# Altium schematic sheet GTR.SchDoc: GTR
size A3; Organization: Altium Limited; Address1: L3, 12a Rodborough Rd; Address2: Frenchs Forest; Address3: NSW; Address4: Australia 2086
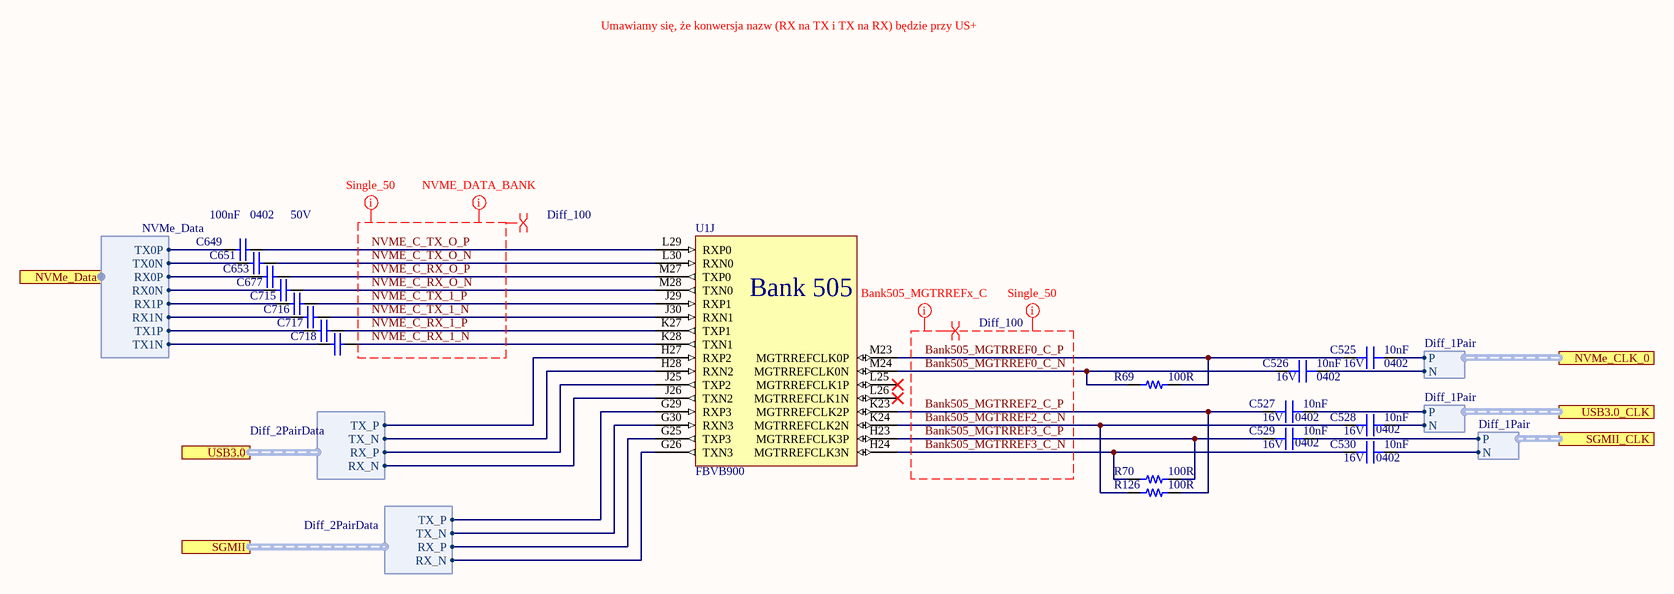
[diagram p0: GTR.SchDoc]

## Parts
C525  10nF  Case/Package: 0402  Voltage Rating (DC): 16V  [CAP 0402/1005 KK]
C526  10nF  Case/Package: 0402  Voltage Rating (DC): 16V  [CAP 0402/1005 KK]
C527  10nF  Case/Package: 0402  Voltage Rating (DC): 16V  [CAP 0402/1005 KK]
C528  10nF  Case/Package: 0402  Voltage Rating (DC): 16V  [CAP 0402/1005 KK]
C529  10nF  Case/Package: 0402  Voltage Rating (DC): 16V  [CAP 0402/1005 KK]
C530  10nF  Case/Package: 0402  Voltage Rating (DC): 16V  [CAP 0402/1005 KK]
C649  100nF  Case Code (Imperial): 0402  Voltage: 50V  [CAP 0402/1005 KK]
C651  100nF  [CAP 0402/1005 KK]  (value not drawn)
C653  100nF  [CAP 0402/1005 KK]  (value not drawn)
C677  100nF  [CAP 0402/1005 KK]  (value not drawn)
C715  100nF  [CAP 0402/1005 KK]  (value not drawn)
C716  100nF  [CAP 0402/1005 KK]  (value not drawn)
C717  100nF  [CAP 0402/1005 KK]  (value not drawn)
C718  100nF  [CAP 0402/1005 KK]  (value not drawn)
R69  100R  [RES 0402/1005 RF KK]
R70  100R  [RES 0402/1005 RF KK]
R126  100R  [RES 0402/1005 RF KK]
U1  FBVB900  [FBVB900 XX]  (part J of 23)

## Ports
NVMe_CLK_0 (harness Diff_1Pair), NVMe_Data (harness NVMe_Data), SGMII (harness Diff_2PairData), SGMII_CLK (harness Diff_1Pair), USB3.0 (harness Diff_2PairData), USB3.0_CLK (harness Diff_1Pair)

## Harnesses
NVMe_Data: RX0P, RX0N, TX0P, TX0N, RX1P, RX1N, TX1P, TX1N
Diff_1Pair: P, N
Diff_2PairData: RX_P, RX_N, TX_P, TX_N

## Nets
Bank505_MGTRREF0_C_N: C526.1 R69.2 U1.M24(MGTRREFCLK0N)
Bank505_MGTRREF0_C_P: C525.1 R69.1 U1.M23(MGTRREFCLK0P)
Bank505_MGTRREF2_C_N: C528.1 R126.2 U1.K24(MGTRREFCLK2N)
Bank505_MGTRREF2_C_P: C527.1 R126.1 U1.K23(MGTRREFCLK2P)
Bank505_MGTRREF3_C_N: C530.1 R70.2 U1.H24(MGTRREFCLK3N)
Bank505_MGTRREF3_C_P: C529.1 R70.1 U1.H23(MGTRREFCLK3P)
NVME_C_RX_1_N: C718.1 U1.K28(TXN1)
NVME_C_RX_1_P: C717.1 U1.K27(TXP1)
NVME_C_RX_O_N: C677.1 U1.M28(TXN0)
NVME_C_RX_O_P: C653.1 U1.M27(TXP0)
NVME_C_TX_1_N: C716.1 U1.J30(RXN1)
NVME_C_TX_1_P: C715.1 U1.J29(RXP1)
NVME_C_TX_O_N: C651.1 U1.L30(RXN0)
NVME_C_TX_O_P: C649.1 U1.L29(RXP0)
NetC525_2: C525.2 ; port NVMe_CLK_0.P
NetC526_2: C526.2 ; port NVMe_CLK_0.N
NetC527_2: C527.2 ; port USB3.0_CLK.P
NetC528_2: C528.2 ; port USB3.0_CLK.N
NetC529_2: C529.2 ; port SGMII_CLK.P
NetC530_2: C530.2 ; port SGMII_CLK.N
NetC649_2: C649.2 ; port NVMe_Data.TX0P
NetC651_2: C651.2 ; port NVMe_Data.TX0N
NetC653_2: C653.2 ; port NVMe_Data.RX0P
NetC677_2: C677.2 ; port NVMe_Data.RX0N
NetC715_2: C715.2 ; port NVMe_Data.RX1P
NetC716_2: C716.2 ; port NVMe_Data.RX1N
NetC717_2: C717.2 ; port NVMe_Data.TX1P
NetC718_2: C718.2 ; port NVMe_Data.TX1N
NetU1_G25: U1.G25(TXP3) ; port SGMII.RX_P
NetU1_G26: U1.G26(TXN3) ; port SGMII.RX_N
NetU1_G29: U1.G29(RXP3) ; port SGMII.TX_P
NetU1_G30: U1.G30(RXN3) ; port SGMII.TX_N
NetU1_H27: U1.H27(RXP2) ; port USB3.0.TX_P
NetU1_H28: U1.H28(RXN2) ; port USB3.0.TX_N
NetU1_J25: U1.J25(TXP2) ; port USB3.0.RX_P
NetU1_J26: U1.J26(TXN2) ; port USB3.0.RX_N

Not connected (* = marked no-connect by the designer): U1 L25(MGTRREFCLK1P)* L26(MGTRREFCLK1N)*

## Layout directives
net class Bank505_MGTRREFx_C: Bank505_MGTRREF0_C_N, Bank505_MGTRREF0_C_P, Bank505_MGTRREF2_C_N, Bank505_MGTRREF2_C_P, Bank505_MGTRREF3_C_N, Bank505_MGTRREF3_C_P
net class NVME_DATA_BANK: NVME_C_RX_1_N, NVME_C_RX_1_P, NVME_C_RX_O_N, NVME_C_RX_O_P, NVME_C_TX_1_N, NVME_C_TX_1_P, NVME_C_TX_O_N, NVME_C_TX_O_P
net class Single_50: Bank505_MGTRREF0_C_N, Bank505_MGTRREF0_C_P, Bank505_MGTRREF2_C_N, Bank505_MGTRREF2_C_P, Bank505_MGTRREF3_C_N, Bank505_MGTRREF3_C_P, NVME_C_RX_1_N, NVME_C_RX_1_P, NVME_C_RX_O_N, NVME_C_RX_O_P, NVME_C_TX_1_N, NVME_C_TX_1_P, NVME_C_TX_O_N, NVME_C_TX_O_P
differential pair; differential pair class Diff_100: Bank505_MGTRREF0_C_N, Bank505_MGTRREF0_C_P, Bank505_MGTRREF2_C_N, Bank505_MGTRREF2_C_P, Bank505_MGTRREF3_C_N, Bank505_MGTRREF3_C_P, NVME_C_RX_1_N, NVME_C_RX_1_P, NVME_C_RX_O_N, NVME_C_RX_O_P, NVME_C_TX_1_N, NVME_C_TX_1_P, NVME_C_TX_O_N, NVME_C_TX_O_P

## Notes on the sheet
- Umawiamy się, że konwersja nazw (RX na TX i TX na RX) będzie przy US+
- Title
- Size:
- Date:
- A3
- Number:
- Time:
- Revision:
- Sheet
- of
- File:
- (in symbol FBVB900, part J) Bank 505

## Library data of the parts
C525-C530 = Capacitor: Manufacturer: KEMET; Manufacturer Part Number: C0402C103K4RACTU; Dielectric Material: Ceramic; Tolerance: 10%; Dielectric: X7R; Dissipation Factor: 3.5%; Supplier 1: Digi-Key; Supplier Part Number 1: 399-1038-1-ND; Stock 1: 1112674; Pricing 1: 1 = 0,10000, 10 = 0,02800, 100 = 0,01240, 500 = 0,00886, 1000 = 0,00696, 2500 = 0,00632, 5000 = 0,00582 (USD); RoHS: Yes; Mount: Surface Mount,PCB; Number of Pins: 2; Case Code (Metric): 1005; Case Code (Imperial): 0402; Contact Plating: Tin,Matte; Min Operating Temperature: -55°C; Max Operating Temperature: 125°C; Capacitance: 10nF; Packaging: Tape and Reel; Package Quantity: 1; Voltage Rating: 16V; Termination: SMD/SMT; Voltage: 16V; Length: 1mm; Height: 0.5mm; Width: 0.02inch; Depth: 0.5mm; Thickness: 0.022inch; Lead Pitch: 0.3mm; Radiation Hardening: No; REACH SVHC: No SVHC; ComponentLink1URL: https://datasheet.ciiva.com/14595/70095383-14595321.pdf?src-supplier=Allied+Electronics; ComponentLink1Description: https://datasheet.ciiva.com/14595/70095383-14595321.pdf?src-supplier=Allied+Electronics; ComponentLink2URL: https://datasheet.ciiva.com/7747/kem-c1002-x7r-smd-7747614.pdf?src-supplier=Element14; ComponentLink2Description: https://datasheet.ciiva.com/7747/kem-c1002-x7r-smd-7747614.pdf?src-supplier=Element14
C649 C651 C653 C677 C715-C718 = Capacitor: CAP CER 0.1UF 50V X5R 0402; Manufacturer: Murata; Manufacturer Part Number: GRM155R61H104KE14D; Dielectric Material: Ceramic; Dissipation Factor: 0.025%; Tolerance: 10%; Supplier 1: Digi-Key; Supplier Part Number 1: 490-10697-1-ND; RoHS: Yes; Category: Ceramic Capacitors; Stock 1: 435607; Pricing 1: 1=0,10000, 10=0,04600, 100=0,02050, 500=0,01464, 1000=0,01150, 2500=0,01045, 5000=0,00961 (USD); Mount: Surface Mount; Case/Package: 0402; Weight: 0.000212oz; Case Code (Metric): 1005; Min Operating Temperature: -55°C; Max Operating Temperature: 85°C; Capacitance: 100nF; Packaging: Tape and Reel; Voltage Rating: 50V; Dielectric: X5R; Termination: SMD/SMT; Composition: Ceramic; Voltage Rating (DC): 50V; Package Quantity: 10000; Length: 1mm; Height: 0.5mm; Width: 0.02inch; Thickness: 0.022inch; Depth: 0.5mm; REACH SVHC: No SVHC; Lead Free: Lead Free; ComponentLink1URL: http://www.farnell.com/datasheets/2079150.pdf?src-supplier=Farnell; ComponentLink1Description: http://www.farnell.com/datasheets/2079150.pdf?src-supplier=Farnell; ComponentLink2URL: http://www.mouser.com/ds/2/281/c02e-2905.pdf?src-supplier=Mouser; ComponentLink2Description: http://www.mouser.com/ds/2/281/c02e-2905.pdf?src-supplier=Mouser; ComponentLink3URL: http://www.farnell.com/datasheets/2079150.pdf?src-supplier=Element14; ComponentLink3Description: http://www.farnell.com/datasheets/2079150.pdf?src-supplier=Element14; ComponentLink4URL: http://search.murata.co.jp/Ceramy/image/img/A01X/G101/ENG/GRM155R61H104KE14-01.pdf?src-supplier=Digi-Key; ComponentLink4Description: http://search.murata.co.jp/Ceramy/image/img/A01X/G101/ENG/GRM155R61H104KE14-01.pdf?src-supplier=Digi-Key
  C651 C653 C677 C715-C718: Case Code (Imperial): 0402; Voltage: 50V
R69 R70 R126 = Resistor: Manufacturer: Vishay Dale; Manufacturer Part Number: CRCW0402100RFKED; Tolerance: 1%; Power Rating: 63mW; Voltage Rating: 50V; Temperature Coefficient: 100ppm/°C; Supplier 1: Digi-Key; Supplier Part Number 1: 541-100LDKR-ND; Stock 1: 93648; Pricing 1: 1 = 0,10000, 10 = 0,03600, 100 = 0,01460, 1000 = 0,00657, 2500 = 0,00570, 5000 = 0,00471 (USD); RoHS: Yes; Mount: Surface Mount; Case/Package: 0402; Weight: 2.3E-05oz; Case Code (Metric): 1005; Case Code (Imperial): 0402; Contact Plating: Tin; Min Operating Temperature: -55°C; Max Operating Temperature: 155°C; Resistance: 100R; Packaging: Tape and Reel; Composition: Thick Film; Termination: SMD/SMT; Package Quantity: 10; Number of Terminations: 2; Military Standard: Not; Max Power Dissipation: 63mW; Voltage Rating (DC): 50V; Features: Automotive AEC-Q200; Working Voltage: 50V; Length: 1mm; Height: 0.35mm; Width: 0.02inch; Depth: 0.5mm; Radiation Hardening: No; REACH SVHC: Unknown; Lead Free: Lead Free; ComponentLink1URL: https://datasheet.ciiva.com/11809/0900766b80d98824-11809081.pdf?src-supplier=RSComponents; ComponentLink1Description: https://datasheet.ciiva.com/11809/0900766b80d98824-11809081.pdf?src-supplier=RSComponents; ComponentLink2URL: https://datasheet.ciiva.com/2463/dcrcwe3-2463094.pdf?src-supplier=Digi-Key; ComponentLink2Description: https://datasheet.ciiva.com/2463/dcrcwe3-2463094.pdf?src-supplier=Digi-Key; ComponentLink3URL: https://datasheet.ciiva.com/16199/dcrcwe3-16199158.pdf?src-supplier=Future+Electronics; ComponentLink3Description: https://datasheet.ciiva.com/16199/dcrcwe3-16199158.pdf?src-supplier=Future+Electronics; ComponentLink4URL: https://datasheet.ciiva.com/2463/dcrcwe3-2463095.pdf?src-supplier=Digi-Key; ComponentLink4Description: https://datasheet.ciiva.com/2463/dcrcwe3-2463095.pdf?src-supplier=Digi-Key; ComponentLink5URL: https://datasheet.ciiva.com/2463/dcrcwe3-2463096.pdf?src-supplier=Digi-Key; ComponentLink5Description: https://datasheet.ciiva.com/2463/dcrcwe3-2463096.pdf?src-supplier=Digi-Key; ComponentLink6URL: https://datasheet.ciiva.com/5552/dcrcwe3-109170-5552168.pdf?src-supplier=Mouser; ComponentLink6Description: https://datasheet.ciiva.com/5552/dcrcwe3-109170-5552168.pdf?src-supplier=Mouser; ComponentLink7URL: https://datasheet.ciiva.com/8083/dcrcwe3-8083977.pdf?src-supplier=Avnet; ComponentLink7Description: https://datasheet.ciiva.com/8083/dcrcwe3-8083977.pdf?src-supplier=Avnet; ComponentLink8URL: https://datasheet.ciiva.com/16722/70201119-16722524.pdf?src-supplier=Allied+Electronics; ComponentLink8Description: https://datasheet.ciiva.com/16722/70201119-16722524.pdf?src-supplier=Allied+Electronics; ComponentLink9URL: https://datasheet.ciiva.com/22673/1697337-22673117.pdf?src-supplier=Element14; ComponentLink9Description: https://datasheet.ciiva.com/22673/1697337-22673117.pdf?src-supplier=Element14; ComponentLink10URL: https://datasheet.ciiva.com/22673/1697337-22673118.pdf?src-supplier=Element14; ComponentLink10Description: https://datasheet.ciiva.com/22673/1697337-22673118.pdf?src-supplier=Element14; ComponentLink11URL: https://datasheet.ciiva.com/3255/dcrcwe3-3255951.pdf?src-supplier=Avnet; ComponentLink11Description: https://datasheet.ciiva.com/3255/dcrcwe3-3255951.pdf?src-supplier=Avnet
U1 = FBVB900: FPGA Zynq UltraScale+ Family 192150 Cells 20nm Technology 0.85V 900-Pin FCBGA Tray; Manufacturer Part Number: XCZU4CG-1FBVB900E; Manufacturer: Xilinx; Peripherals: WDT,DMA; Interface: I2C,SPI,USB,Ethernet,MMC,SDIO,SD,UART,USART,EBI/EMI; Core Architecture: ARM; RAM Size: 256KB; Frequency: 500MHz; Number of I/Os: 204; Supplier 1: Mouser; Supplier Part Number 1: 217-CZU4CG-1FBVB900E; Stock 1: 3; Pricing 1: 1=0,00000, 5=1060,70000 (USD); RoHS: No; Case/Package: FCBGA; Min Operating Temperature: 0°C; Max Operating Temperature: 100°C; Packaging: Tray; ComponentLink1URL: https://www.xilinx.com/support/documentation/data_sheets/ds891-zynq-ultrascale-plus-overview.pdf?src-supplier=Digi-Key; ComponentLink1Description: https://www.xilinx.com/support/documentation/data_sheets/ds891-zynq-ultrascale-plus-overview.pdf?src-supplier=Digi-Key; ComponentLink2URL: https://www.xilinx.com/support/documentation/data_sheets/ds925-zynq-ultrascale-plus.pdf?src-supplier=Digi-Key; ComponentLink2Description: https://www.xilinx.com/support/documentation/data_sheets/ds925-zynq-ultrascale-plus.pdf?src-supplier=Digi-Key; Supplier 2: Avnet; Supplier 3: Digi-Key; Supplier Part Number 2: XCZU4CG-1FBVB900E; Supplier Part Number 3: XCZU4CG-1FBVB900E-ND